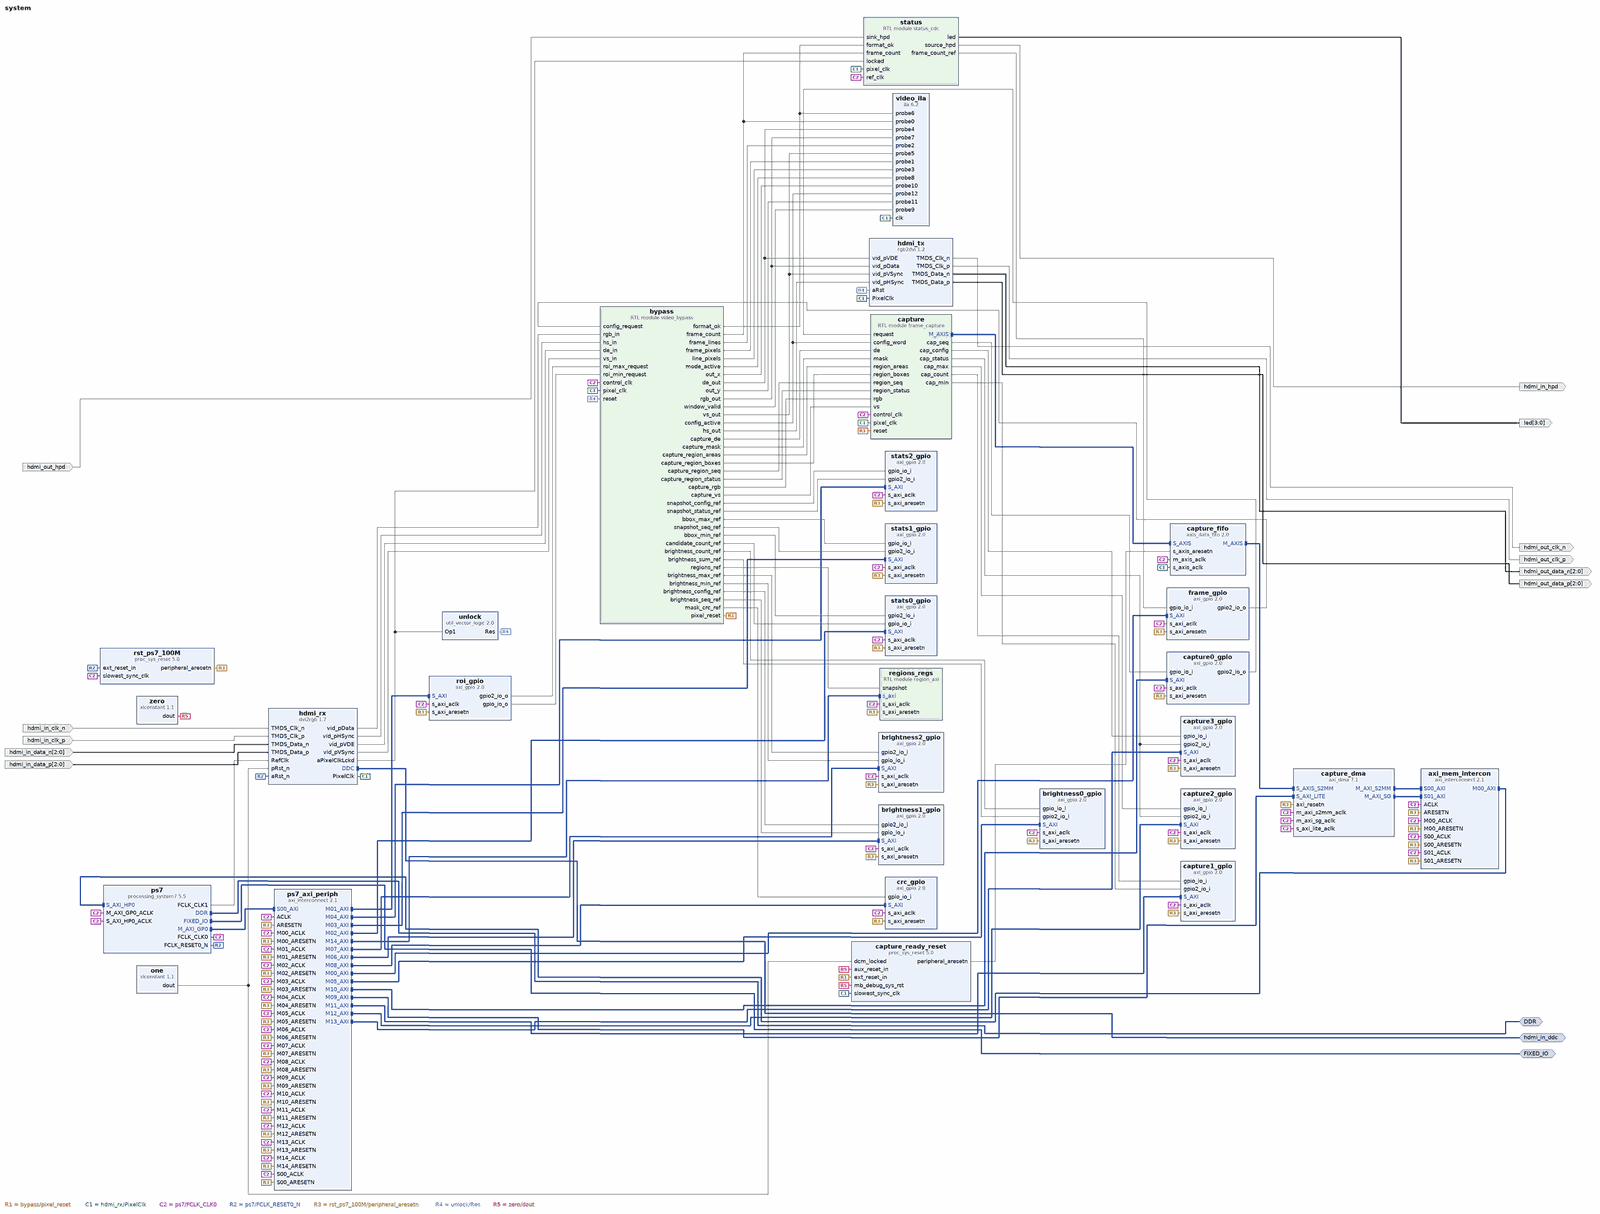
[diagram p0: block diagram of the top level, whole]
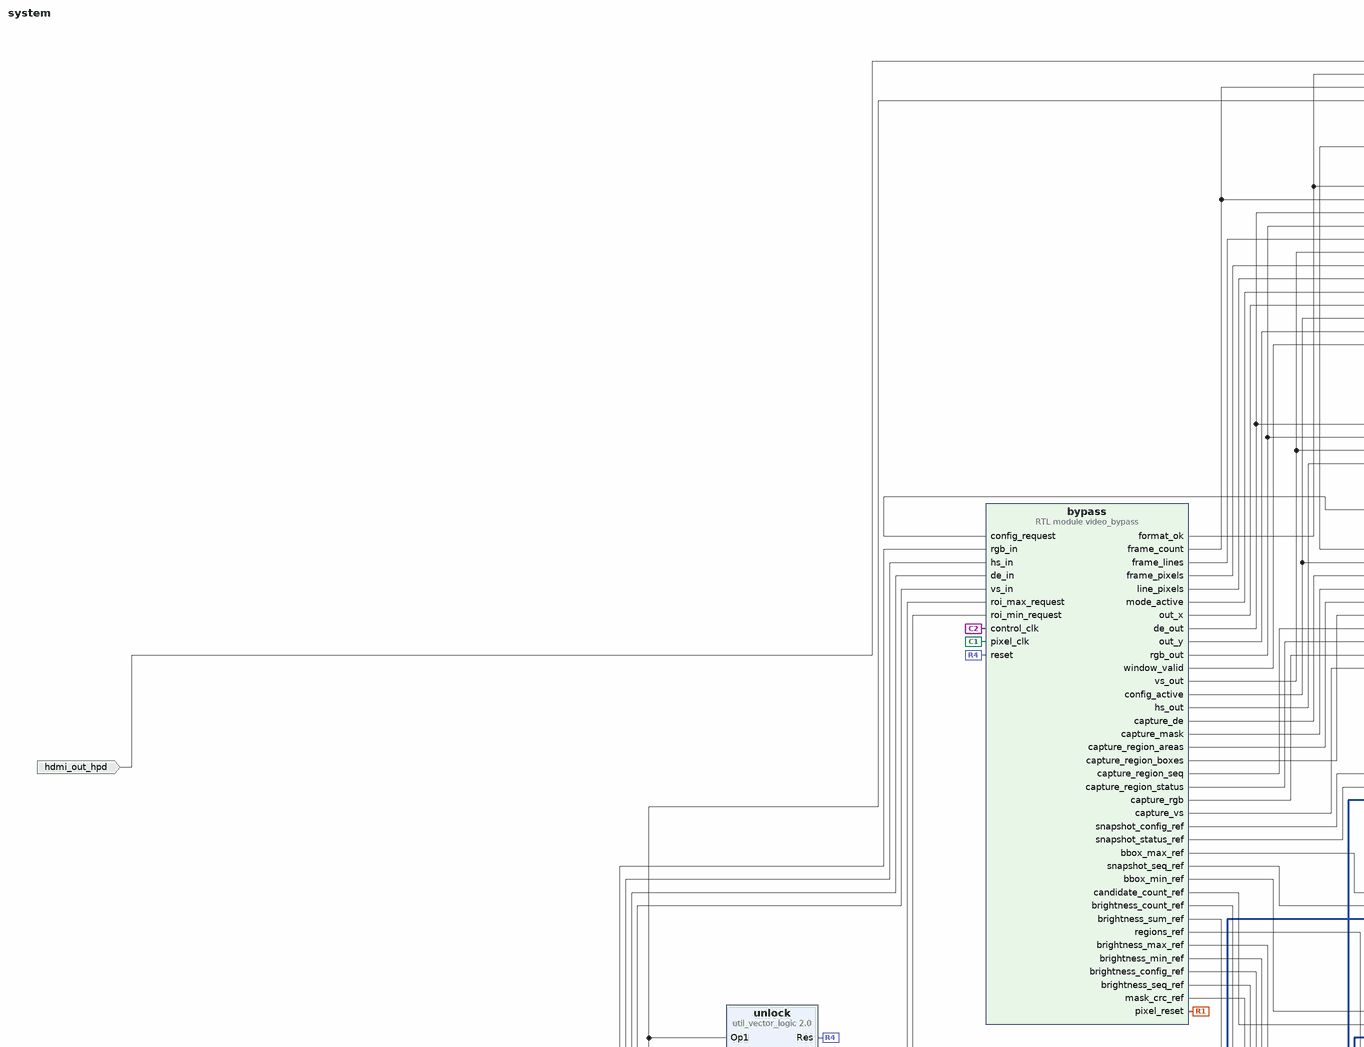
[diagram p1: block diagram of the top level, upper left part]
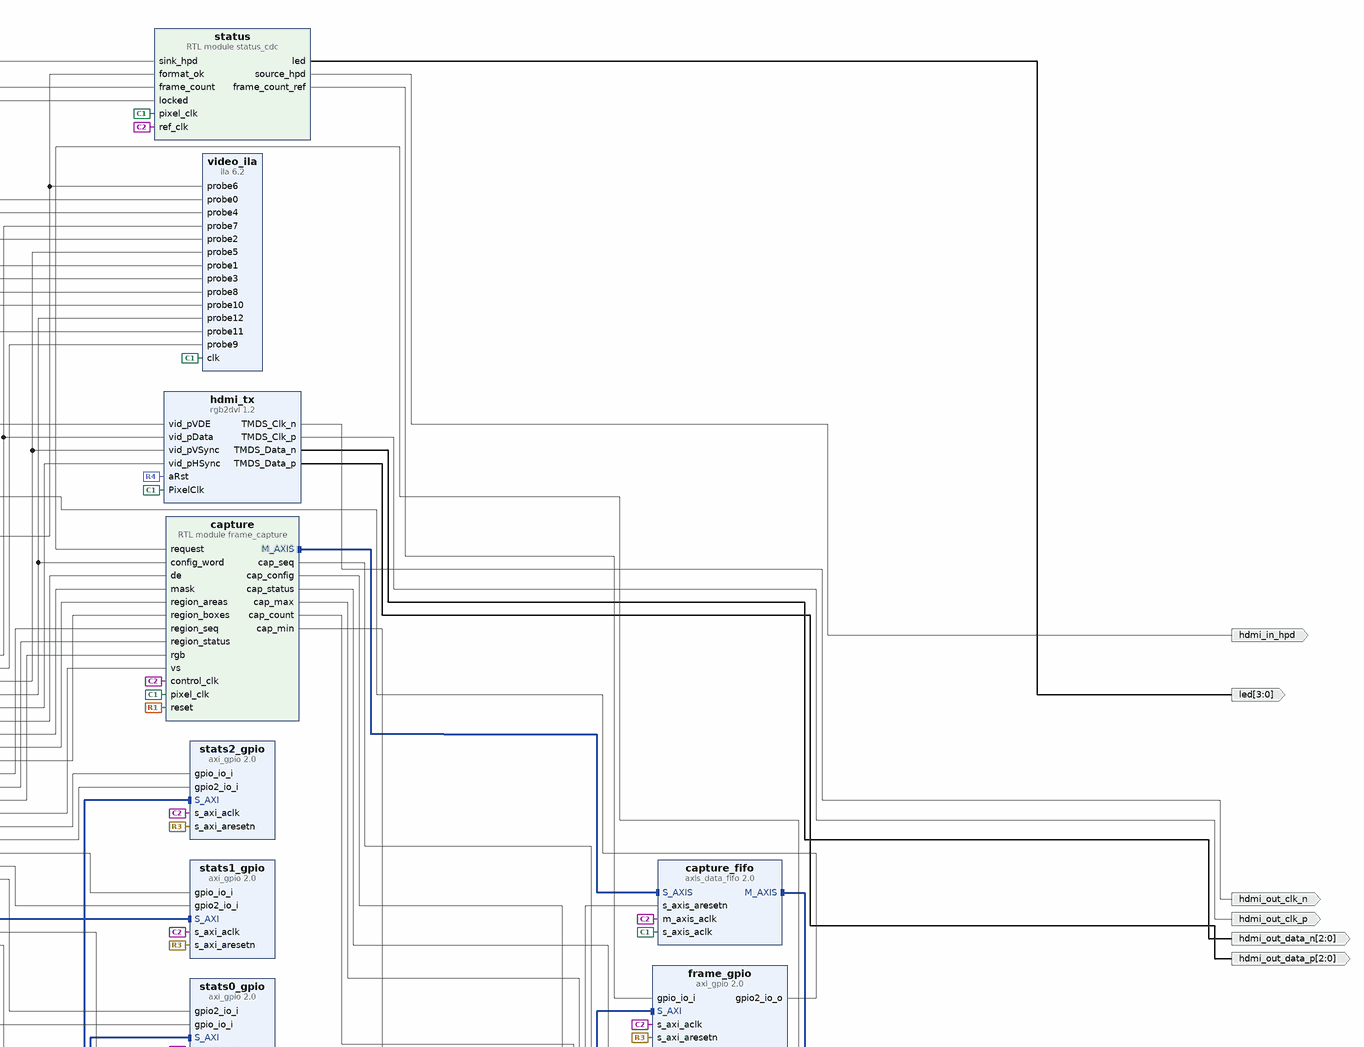
[diagram p2: block diagram of the top level, upper right part]
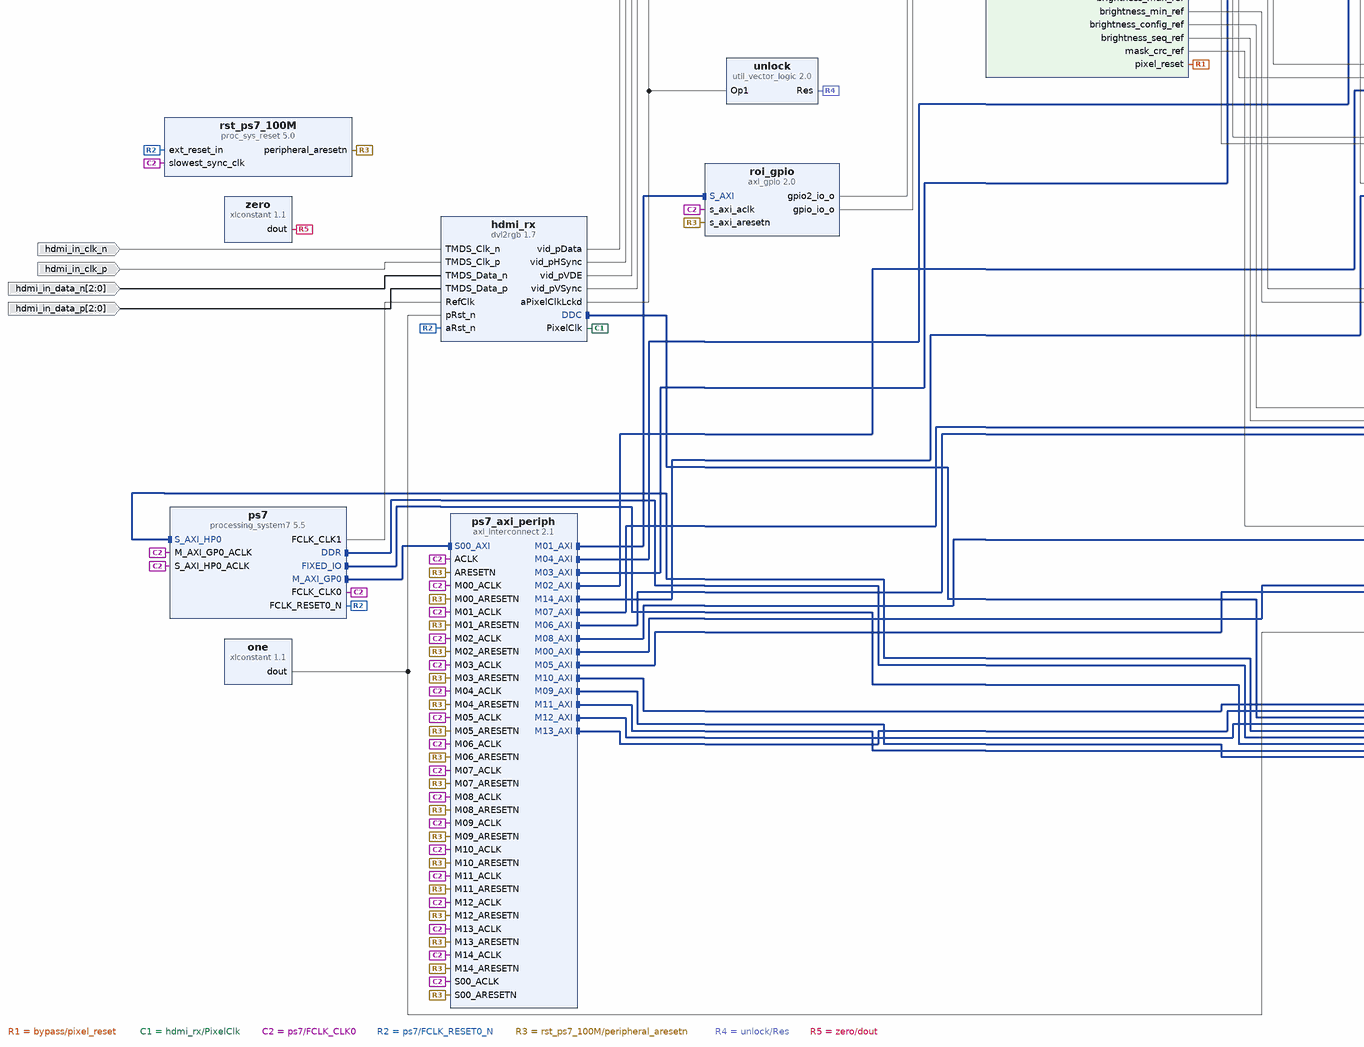
[diagram p3: block diagram of the top level, lower left part]
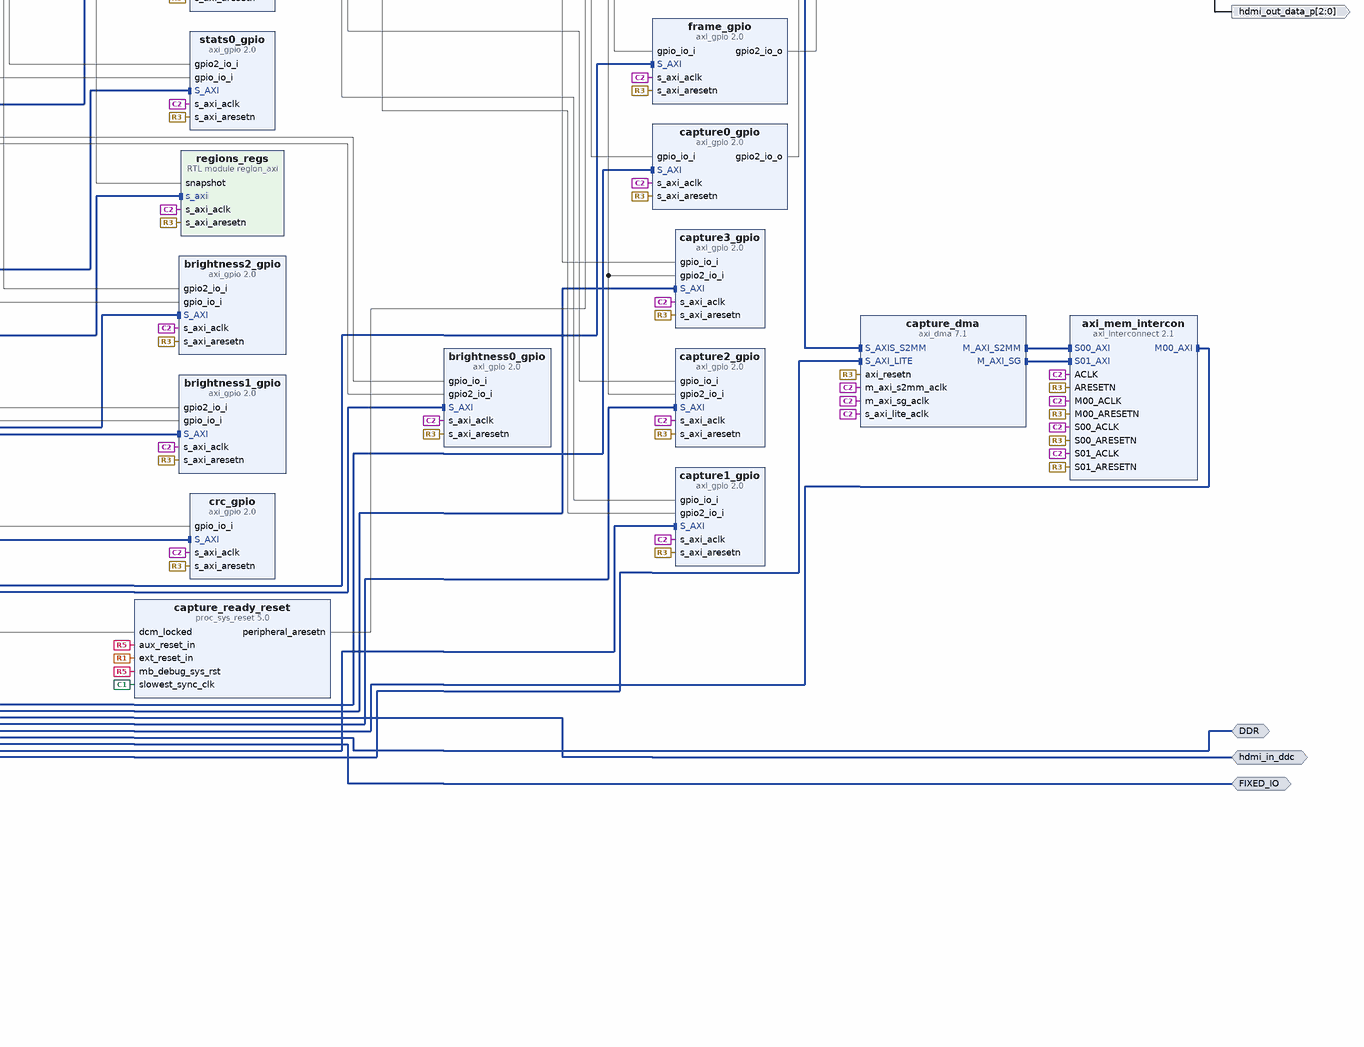
[diagram p4: block diagram of the top level, lower right part]
# Vivado block design system, xc7z020clg400-1, Vivado 2025.2
create_bd_design system

create_bd_intf_port -mode Master -vlnv xilinx.com:interface:ddrx_rtl:1.0 DDR
create_bd_intf_port -mode Master -vlnv xilinx.com:display_processing_system7:fixedio_rtl:1.0 FIXED_IO
create_bd_intf_port -mode Master -vlnv xilinx.com:interface:iic_rtl:1.0 hdmi_in_ddc
create_bd_port -dir I hdmi_in_clk_p
create_bd_port -dir I hdmi_in_clk_n
create_bd_port -dir I -from 2 -to 0 hdmi_in_data_p
create_bd_port -dir I -from 2 -to 0 hdmi_in_data_n
create_bd_port -dir O hdmi_out_clk_p
create_bd_port -dir O hdmi_out_clk_n
create_bd_port -dir O -from 2 -to 0 hdmi_out_data_p
create_bd_port -dir O -from 2 -to 0 hdmi_out_data_n
create_bd_port -dir I hdmi_out_hpd
create_bd_port -dir O hdmi_in_hpd
create_bd_port -dir O -from 3 -to 0 led

create_bd_cell -type ip -vlnv xilinx.com:ip:processing_system7:5.5 ps7
set_property -dict [list \
  CONFIG.PCW_APU_PERIPHERAL_FREQMHZ 650 \
  CONFIG.PCW_CRYSTAL_PERIPHERAL_FREQMHZ 50 \
  CONFIG.PCW_ENET0_ENET0_IO {MIO 16 .. 27} \
  CONFIG.PCW_ENET0_GRP_MDIO_ENABLE 1 \
  CONFIG.PCW_ENET0_GRP_MDIO_IO {MIO 52 .. 53} \
  CONFIG.PCW_ENET0_PERIPHERAL_ENABLE 1 \
  CONFIG.PCW_ENET0_RESET_ENABLE 1 \
  CONFIG.PCW_ENET0_RESET_IO {MIO 9} \
  CONFIG.PCW_ENET_RESET_ENABLE 1 \
  CONFIG.PCW_ENET_RESET_SELECT {Share reset pin} \
  CONFIG.PCW_EN_CLK1_PORT 1 \
  CONFIG.PCW_FPGA0_PERIPHERAL_FREQMHZ 100 \
  CONFIG.PCW_FPGA1_PERIPHERAL_FREQMHZ 200 \
  CONFIG.PCW_FPGA2_PERIPHERAL_FREQMHZ 200 \
  CONFIG.PCW_FPGA3_PERIPHERAL_FREQMHZ 166.67 \
  CONFIG.PCW_FPGA_FCLK1_ENABLE 1 \
  CONFIG.PCW_GPIO_MIO_GPIO_ENABLE 1 \
  CONFIG.PCW_GPIO_MIO_GPIO_IO MIO \
  CONFIG.PCW_I2C_RESET_ENABLE 1 \
  CONFIG.PCW_IRQ_F2P_INTR 1 \
  CONFIG.PCW_PERIPHERAL_BOARD_PRESET None \
  CONFIG.PCW_PRESET_BANK1_VOLTAGE {LVCMOS 1.8V} \
  CONFIG.PCW_QSPI_GRP_FBCLK_ENABLE 1 \
  CONFIG.PCW_QSPI_GRP_FBCLK_IO {MIO 8} \
  CONFIG.PCW_QSPI_GRP_SINGLE_SS_ENABLE 1 \
  CONFIG.PCW_QSPI_GRP_SINGLE_SS_IO {MIO 1 .. 6} \
  CONFIG.PCW_QSPI_PERIPHERAL_ENABLE 1 \
  CONFIG.PCW_QSPI_QSPI_IO {MIO 1 .. 6} \
  CONFIG.PCW_SD0_GRP_CD_ENABLE 1 \
  CONFIG.PCW_SD0_GRP_CD_IO {MIO 47} \
  CONFIG.PCW_SD0_GRP_WP_ENABLE 0 \
  CONFIG.PCW_SD0_PERIPHERAL_ENABLE 1 \
  CONFIG.PCW_SD0_SD0_IO {MIO 40 .. 45} \
  CONFIG.PCW_SDIO_PERIPHERAL_FREQMHZ 50 \
  CONFIG.PCW_SINGLE_QSPI_DATA_MODE x4 \
  CONFIG.PCW_UART0_PERIPHERAL_ENABLE 1 \
  CONFIG.PCW_UART0_UART0_IO {MIO 14 .. 15} \
  CONFIG.PCW_UART1_PERIPHERAL_ENABLE 0 \
  CONFIG.PCW_UART_PERIPHERAL_FREQMHZ 100 \
  CONFIG.PCW_UIPARAM_DDR_BUS_WIDTH {16 Bit} \
  CONFIG.PCW_UIPARAM_DDR_FREQ_MHZ 525 \
  CONFIG.PCW_UIPARAM_DDR_PARTNO {MT41J256M16 RE-125} \
  CONFIG.PCW_USB0_PERIPHERAL_ENABLE 1 \
  CONFIG.PCW_USB0_RESET_ENABLE 1 \
  CONFIG.PCW_USB0_RESET_IO {MIO 46} \
  CONFIG.PCW_USB0_USB0_IO {MIO 28 .. 39} \
  CONFIG.PCW_USB_RESET_ENABLE 1 \
  CONFIG.PCW_USB_RESET_SELECT {Share reset pin} \
  CONFIG.PCW_USE_FABRIC_INTERRUPT 1 \
  CONFIG.PCW_USE_S_AXI_HP0 1 \
] [get_bd_cells ps7]
# 494 more settings of ps7 are not shown: defaults, MIO pin electricals, DDR timing, and values the tool derives
create_bd_cell -type ip -vlnv digilentinc.com:ip:dvi2rgb:1.7 hdmi_rx
set_property -dict [list \
  CONFIG.kAddBUFG true \
  CONFIG.kClkRange 2 \
  CONFIG.kEdidFileName 720p_edid.data \
  CONFIG.kEmulateDDC true \
  CONFIG.kEnableSerialClkOutput true \
  CONFIG.kRstActiveHigh false \
] [get_bd_cells hdmi_rx]
create_bd_cell -type ip -vlnv digilentinc.com:ip:rgb2dvi:1.2 hdmi_tx
set_property -dict {CONFIG.kClkRange 2 CONFIG.kGenerateSerialClk true CONFIG.kRstActiveHigh true} [get_bd_cells hdmi_tx]
create_bd_cell -type module -reference video_bypass bypass
create_bd_cell -type module -reference status_cdc status
create_bd_cell -type ip -vlnv xilinx.com:ip:xlconstant:1.1 zero
set_property -dict {CONFIG.CONST_VAL 0} [get_bd_cells zero]
create_bd_cell -type ip -vlnv xilinx.com:ip:xlconstant:1.1 one
set_property -dict {CONFIG.CONST_VAL 1} [get_bd_cells one]
create_bd_cell -type ip -vlnv xilinx.com:ip:util_vector_logic:2.0 unlock
set_property -dict {CONFIG.C_OPERATION not CONFIG.C_SIZE 1} [get_bd_cells unlock]
create_bd_cell -type ip -vlnv xilinx.com:ip:axi_gpio:2.0 frame_gpio
set_property -dict [list \
  CONFIG.C_ALL_INPUTS 1 \
  CONFIG.C_ALL_OUTPUTS_2 1 \
  CONFIG.C_GPIO2_WIDTH 32 \
  CONFIG.C_GPIO_WIDTH 32 \
  CONFIG.C_IS_DUAL 1 \
] [get_bd_cells frame_gpio]
create_bd_cell -type ip -vlnv xilinx.com:ip:axi_interconnect:2.1 ps7_axi_periph
set_property -dict {CONFIG.NUM_MI 15} [get_bd_cells ps7_axi_periph]
create_bd_cell -type ip -vlnv xilinx.com:ip:proc_sys_reset:5.0 rst_ps7_100M
create_bd_cell -type ip -vlnv xilinx.com:ip:axi_gpio:2.0 roi_gpio
set_property -dict [list \
  CONFIG.C_ALL_OUTPUTS 1 \
  CONFIG.C_ALL_OUTPUTS_2 1 \
  CONFIG.C_GPIO2_WIDTH 32 \
  CONFIG.C_GPIO_WIDTH 32 \
  CONFIG.C_IS_DUAL 1 \
] [get_bd_cells roi_gpio]
create_bd_cell -type ip -vlnv xilinx.com:ip:axi_gpio:2.0 stats0_gpio
set_property -dict [list \
  CONFIG.C_ALL_INPUTS 1 \
  CONFIG.C_ALL_INPUTS_2 1 \
  CONFIG.C_GPIO2_WIDTH 32 \
  CONFIG.C_GPIO_WIDTH 32 \
  CONFIG.C_IS_DUAL 1 \
] [get_bd_cells stats0_gpio]
create_bd_cell -type ip -vlnv xilinx.com:ip:axi_gpio:2.0 stats1_gpio
set_property -dict [list \
  CONFIG.C_ALL_INPUTS 1 \
  CONFIG.C_ALL_INPUTS_2 1 \
  CONFIG.C_GPIO2_WIDTH 32 \
  CONFIG.C_GPIO_WIDTH 32 \
  CONFIG.C_IS_DUAL 1 \
] [get_bd_cells stats1_gpio]
create_bd_cell -type ip -vlnv xilinx.com:ip:axi_gpio:2.0 stats2_gpio
set_property -dict [list \
  CONFIG.C_ALL_INPUTS 1 \
  CONFIG.C_ALL_INPUTS_2 1 \
  CONFIG.C_GPIO2_WIDTH 32 \
  CONFIG.C_GPIO_WIDTH 32 \
  CONFIG.C_IS_DUAL 1 \
] [get_bd_cells stats2_gpio]
create_bd_cell -type ip -vlnv xilinx.com:ip:axi_gpio:2.0 brightness0_gpio
set_property -dict [list \
  CONFIG.C_ALL_INPUTS 1 \
  CONFIG.C_ALL_INPUTS_2 1 \
  CONFIG.C_GPIO2_WIDTH 32 \
  CONFIG.C_GPIO_WIDTH 32 \
  CONFIG.C_IS_DUAL 1 \
] [get_bd_cells brightness0_gpio]
create_bd_cell -type ip -vlnv xilinx.com:ip:axi_gpio:2.0 brightness1_gpio
set_property -dict [list \
  CONFIG.C_ALL_INPUTS 1 \
  CONFIG.C_ALL_INPUTS_2 1 \
  CONFIG.C_GPIO2_WIDTH 32 \
  CONFIG.C_GPIO_WIDTH 32 \
  CONFIG.C_IS_DUAL 1 \
] [get_bd_cells brightness1_gpio]
create_bd_cell -type ip -vlnv xilinx.com:ip:axi_gpio:2.0 brightness2_gpio
set_property -dict [list \
  CONFIG.C_ALL_INPUTS 1 \
  CONFIG.C_ALL_INPUTS_2 1 \
  CONFIG.C_GPIO2_WIDTH 32 \
  CONFIG.C_GPIO_WIDTH 32 \
  CONFIG.C_IS_DUAL 1 \
] [get_bd_cells brightness2_gpio]
create_bd_cell -type ip -vlnv xilinx.com:ip:axi_gpio:2.0 crc_gpio
set_property -dict {CONFIG.C_ALL_INPUTS 1 CONFIG.C_GPIO_WIDTH 32} [get_bd_cells crc_gpio]
create_bd_cell -type ip -vlnv xilinx.com:ip:ila:6.2 video_ila
set_property -dict [list \
  CONFIG.C_DATA_DEPTH 1024 \
  CONFIG.C_MONITOR_TYPE Native \
  CONFIG.C_NUM_OF_PROBES 13 \
  CONFIG.C_PROBE0_WIDTH 32 \
  CONFIG.C_PROBE10_WIDTH 16 \
  CONFIG.C_PROBE11_WIDTH 16 \
  CONFIG.C_PROBE12_WIDTH 32 \
  CONFIG.C_PROBE1_WIDTH 32 \
  CONFIG.C_PROBE2_WIDTH 16 \
  CONFIG.C_PROBE3_WIDTH 16 \
  CONFIG.C_PROBE4_WIDTH 1 \
  CONFIG.C_PROBE5_WIDTH 1 \
  CONFIG.C_PROBE6_WIDTH 1 \
  CONFIG.C_PROBE7_WIDTH 24 \
  CONFIG.C_PROBE8_WIDTH 3 \
  CONFIG.C_PROBE9_WIDTH 1 \
] [get_bd_cells video_ila]
create_bd_cell -type module -reference frame_capture capture
create_bd_cell -type ip -vlnv xilinx.com:ip:axis_data_fifo:2.0 capture_fifo
set_property -dict [list \
  CONFIG.FIFO_DEPTH 4096 \
  CONFIG.HAS_TKEEP 0 \
  CONFIG.HAS_TLAST 1 \
  CONFIG.IS_ACLK_ASYNC 1 \
  CONFIG.TDATA_NUM_BYTES 4 \
] [get_bd_cells capture_fifo]
create_bd_cell -type ip -vlnv xilinx.com:ip:proc_sys_reset:5.0 capture_ready_reset
set_property -dict {CONFIG.C_AUX_RESET_HIGH 1} [get_bd_cells capture_ready_reset]
create_bd_cell -type ip -vlnv xilinx.com:ip:axi_dma:7.1 capture_dma
set_property -dict [list \
  CONFIG.c_include_mm2s 0 \
  CONFIG.c_include_s2mm 1 \
  CONFIG.c_include_sg 1 \
  CONFIG.c_m_axi_s2mm_data_width 64 \
  CONFIG.c_s2mm_burst_size 64 \
  CONFIG.c_s_axis_s2mm_tdata_width 32 \
  CONFIG.c_sg_include_stscntrl_strm 0 \
  CONFIG.c_sg_length_width 26 \
] [get_bd_cells capture_dma]
create_bd_cell -type ip -vlnv xilinx.com:ip:axi_interconnect:2.1 axi_mem_intercon
set_property -dict {CONFIG.NUM_MI 1 CONFIG.NUM_SI 2} [get_bd_cells axi_mem_intercon]
create_bd_cell -type ip -vlnv xilinx.com:ip:axi_gpio:2.0 capture0_gpio
set_property -dict [list \
  CONFIG.C_ALL_INPUTS 1 \
  CONFIG.C_ALL_INPUTS_2 0 \
  CONFIG.C_ALL_OUTPUTS_2 1 \
  CONFIG.C_GPIO2_WIDTH 32 \
  CONFIG.C_GPIO_WIDTH 32 \
  CONFIG.C_IS_DUAL 1 \
] [get_bd_cells capture0_gpio]
create_bd_cell -type ip -vlnv xilinx.com:ip:axi_gpio:2.0 capture1_gpio
set_property -dict [list \
  CONFIG.C_ALL_INPUTS 1 \
  CONFIG.C_ALL_INPUTS_2 1 \
  CONFIG.C_GPIO2_WIDTH 32 \
  CONFIG.C_GPIO_WIDTH 32 \
  CONFIG.C_IS_DUAL 1 \
] [get_bd_cells capture1_gpio]
create_bd_cell -type ip -vlnv xilinx.com:ip:axi_gpio:2.0 capture2_gpio
set_property -dict [list \
  CONFIG.C_ALL_INPUTS 1 \
  CONFIG.C_ALL_INPUTS_2 1 \
  CONFIG.C_GPIO2_WIDTH 32 \
  CONFIG.C_GPIO_WIDTH 32 \
  CONFIG.C_IS_DUAL 1 \
] [get_bd_cells capture2_gpio]
create_bd_cell -type ip -vlnv xilinx.com:ip:axi_gpio:2.0 capture3_gpio
set_property -dict [list \
  CONFIG.C_ALL_INPUTS 1 \
  CONFIG.C_ALL_INPUTS_2 1 \
  CONFIG.C_GPIO2_WIDTH 32 \
  CONFIG.C_GPIO_WIDTH 32 \
  CONFIG.C_IS_DUAL 1 \
] [get_bd_cells capture3_gpio]
create_bd_cell -type module -reference region_axi regions_regs

# ---- connections ----

connect_bd_intf_net [get_bd_intf_pins axi_mem_intercon/M00_AXI] [get_bd_intf_pins ps7/S_AXI_HP0]
connect_bd_intf_net [get_bd_intf_pins capture/M_AXIS] [get_bd_intf_pins capture_fifo/S_AXIS]
connect_bd_intf_net [get_bd_intf_pins capture_dma/M_AXI_S2MM] [get_bd_intf_pins axi_mem_intercon/S00_AXI]
connect_bd_intf_net [get_bd_intf_pins capture_dma/M_AXI_SG] [get_bd_intf_pins axi_mem_intercon/S01_AXI]
connect_bd_intf_net [get_bd_intf_pins capture_fifo/M_AXIS] [get_bd_intf_pins capture_dma/S_AXIS_S2MM]
connect_bd_intf_net [get_bd_intf_ports hdmi_in_ddc] [get_bd_intf_pins hdmi_rx/DDC]
connect_bd_intf_net [get_bd_intf_ports DDR] [get_bd_intf_pins ps7/DDR]
connect_bd_intf_net [get_bd_intf_ports FIXED_IO] [get_bd_intf_pins ps7/FIXED_IO]
connect_bd_intf_net [get_bd_intf_pins ps7/M_AXI_GP0] [get_bd_intf_pins ps7_axi_periph/S00_AXI]
connect_bd_intf_net [get_bd_intf_pins ps7_axi_periph/M00_AXI] [get_bd_intf_pins frame_gpio/S_AXI]
connect_bd_intf_net [get_bd_intf_pins ps7_axi_periph/M01_AXI] [get_bd_intf_pins roi_gpio/S_AXI]
connect_bd_intf_net [get_bd_intf_pins ps7_axi_periph/M02_AXI] [get_bd_intf_pins stats0_gpio/S_AXI]
connect_bd_intf_net [get_bd_intf_pins ps7_axi_periph/M03_AXI] [get_bd_intf_pins stats1_gpio/S_AXI]
connect_bd_intf_net [get_bd_intf_pins ps7_axi_periph/M04_AXI] [get_bd_intf_pins stats2_gpio/S_AXI]
connect_bd_intf_net [get_bd_intf_pins ps7_axi_periph/M05_AXI] [get_bd_intf_pins brightness0_gpio/S_AXI]
connect_bd_intf_net [get_bd_intf_pins ps7_axi_periph/M06_AXI] [get_bd_intf_pins brightness1_gpio/S_AXI]
connect_bd_intf_net [get_bd_intf_pins ps7_axi_periph/M07_AXI] [get_bd_intf_pins brightness2_gpio/S_AXI]
connect_bd_intf_net [get_bd_intf_pins ps7_axi_periph/M08_AXI] [get_bd_intf_pins crc_gpio/S_AXI]
connect_bd_intf_net [get_bd_intf_pins ps7_axi_periph/M09_AXI] [get_bd_intf_pins capture_dma/S_AXI_LITE]
connect_bd_intf_net [get_bd_intf_pins ps7_axi_periph/M10_AXI] [get_bd_intf_pins capture0_gpio/S_AXI]
connect_bd_intf_net [get_bd_intf_pins ps7_axi_periph/M11_AXI] [get_bd_intf_pins capture1_gpio/S_AXI]
connect_bd_intf_net [get_bd_intf_pins ps7_axi_periph/M12_AXI] [get_bd_intf_pins capture2_gpio/S_AXI]
connect_bd_intf_net [get_bd_intf_pins ps7_axi_periph/M13_AXI] [get_bd_intf_pins capture3_gpio/S_AXI]
connect_bd_intf_net [get_bd_intf_pins ps7_axi_periph/M14_AXI] [get_bd_intf_pins regions_regs/s_axi]
connect_bd_net [get_bd_pins bypass/bbox_max_ref] [get_bd_pins stats1_gpio/gpio_io_i]
connect_bd_net [get_bd_pins bypass/bbox_min_ref] [get_bd_pins stats0_gpio/gpio2_io_i]
connect_bd_net [get_bd_pins bypass/brightness_config_ref] [get_bd_pins brightness1_gpio/gpio2_io_i]
connect_bd_net [get_bd_pins bypass/brightness_count_ref] [get_bd_pins brightness0_gpio/gpio_io_i]
connect_bd_net [get_bd_pins bypass/brightness_max_ref] [get_bd_pins brightness2_gpio/gpio2_io_i]
connect_bd_net [get_bd_pins bypass/brightness_min_ref] [get_bd_pins brightness2_gpio/gpio_io_i]
connect_bd_net [get_bd_pins bypass/brightness_seq_ref] [get_bd_pins brightness1_gpio/gpio_io_i]
connect_bd_net [get_bd_pins bypass/brightness_sum_ref] [get_bd_pins brightness0_gpio/gpio2_io_i]
connect_bd_net [get_bd_pins bypass/candidate_count_ref] [get_bd_pins stats0_gpio/gpio_io_i]
connect_bd_net [get_bd_pins bypass/capture_de] [get_bd_pins capture/de]
connect_bd_net [get_bd_pins bypass/capture_mask] [get_bd_pins capture/mask]
connect_bd_net [get_bd_pins bypass/capture_region_areas] [get_bd_pins capture/region_areas]
connect_bd_net [get_bd_pins bypass/capture_region_boxes] [get_bd_pins capture/region_boxes]
connect_bd_net [get_bd_pins bypass/capture_region_seq] [get_bd_pins capture/region_seq]
connect_bd_net [get_bd_pins bypass/capture_region_status] [get_bd_pins capture/region_status]
connect_bd_net [get_bd_pins bypass/capture_rgb] [get_bd_pins capture/rgb]
connect_bd_net [get_bd_pins bypass/capture_vs] [get_bd_pins capture/vs]
connect_bd_net [get_bd_pins bypass/config_active] [get_bd_pins video_ila/probe12] [get_bd_pins capture/config_word]
connect_bd_net [get_bd_pins bypass/de_out] [get_bd_pins hdmi_tx/vid_pVDE] [get_bd_pins video_ila/probe4]
connect_bd_net [get_bd_pins bypass/format_ok] [get_bd_pins status/format_ok] [get_bd_pins video_ila/probe6]
connect_bd_net [get_bd_pins bypass/frame_count] [get_bd_pins status/frame_count] [get_bd_pins video_ila/probe0]
connect_bd_net [get_bd_pins bypass/frame_lines] [get_bd_pins video_ila/probe2]
connect_bd_net [get_bd_pins bypass/frame_pixels] [get_bd_pins video_ila/probe1]
connect_bd_net [get_bd_pins bypass/hs_out] [get_bd_pins hdmi_tx/vid_pHSync]
connect_bd_net [get_bd_pins bypass/line_pixels] [get_bd_pins video_ila/probe3]
connect_bd_net [get_bd_pins bypass/mask_crc_ref] [get_bd_pins crc_gpio/gpio_io_i]
connect_bd_net [get_bd_pins bypass/mode_active] [get_bd_pins video_ila/probe8]
connect_bd_net [get_bd_pins bypass/out_x] [get_bd_pins video_ila/probe10]
connect_bd_net [get_bd_pins bypass/out_y] [get_bd_pins video_ila/probe11]
connect_bd_net [get_bd_pins bypass/pixel_reset] [get_bd_pins capture/reset] [get_bd_pins capture_ready_reset/ext_reset_in]
connect_bd_net [get_bd_pins bypass/regions_ref] [get_bd_pins regions_regs/snapshot]
connect_bd_net [get_bd_pins bypass/rgb_out] [get_bd_pins hdmi_tx/vid_pData] [get_bd_pins video_ila/probe7]
connect_bd_net [get_bd_pins bypass/snapshot_config_ref] [get_bd_pins stats2_gpio/gpio_io_i]
connect_bd_net [get_bd_pins bypass/snapshot_seq_ref] [get_bd_pins stats1_gpio/gpio2_io_i]
connect_bd_net [get_bd_pins bypass/snapshot_status_ref] [get_bd_pins stats2_gpio/gpio2_io_i]
connect_bd_net [get_bd_pins bypass/vs_out] [get_bd_pins hdmi_tx/vid_pVSync] [get_bd_pins video_ila/probe5]
connect_bd_net [get_bd_pins bypass/window_valid] [get_bd_pins video_ila/probe9]
connect_bd_net [get_bd_pins capture0_gpio/gpio2_io_o] [get_bd_pins capture/request]
connect_bd_net [get_bd_pins capture/cap_config] [get_bd_pins capture3_gpio/gpio_io_i]
connect_bd_net [get_bd_pins capture/cap_count] [get_bd_pins capture1_gpio/gpio_io_i]
connect_bd_net [get_bd_pins capture/cap_max] [get_bd_pins capture2_gpio/gpio_io_i]
connect_bd_net [get_bd_pins capture/cap_min] [get_bd_pins capture1_gpio/gpio2_io_i]
connect_bd_net [get_bd_pins capture/cap_seq] [get_bd_pins capture0_gpio/gpio_io_i]
connect_bd_net [get_bd_pins capture/cap_status] [get_bd_pins capture2_gpio/gpio2_io_i] [get_bd_pins capture3_gpio/gpio2_io_i]
connect_bd_net [get_bd_pins capture_ready_reset/peripheral_aresetn] [get_bd_pins capture_fifo/s_axis_aresetn]
connect_bd_net [get_bd_pins frame_gpio/gpio2_io_o] [get_bd_pins bypass/config_request]
connect_bd_net [get_bd_ports hdmi_in_clk_n] [get_bd_pins hdmi_rx/TMDS_Clk_n]
connect_bd_net [get_bd_ports hdmi_in_clk_p] [get_bd_pins hdmi_rx/TMDS_Clk_p]
connect_bd_net [get_bd_ports hdmi_in_data_n] [get_bd_pins hdmi_rx/TMDS_Data_n]
connect_bd_net [get_bd_ports hdmi_in_data_p] [get_bd_pins hdmi_rx/TMDS_Data_p]
connect_bd_net [get_bd_ports hdmi_out_hpd] [get_bd_pins status/sink_hpd]
connect_bd_net [get_bd_pins hdmi_rx/PixelClk] \
  [get_bd_pins bypass/pixel_clk] [get_bd_pins status/pixel_clk] [get_bd_pins hdmi_tx/PixelClk] [get_bd_pins video_ila/clk] \
  [get_bd_pins capture/pixel_clk] [get_bd_pins capture_fifo/s_axis_aclk] [get_bd_pins capture_ready_reset/slowest_sync_clk]
connect_bd_net [get_bd_pins hdmi_rx/aPixelClkLckd] [get_bd_pins unlock/Op1] [get_bd_pins status/locked]
connect_bd_net [get_bd_pins hdmi_rx/vid_pData] [get_bd_pins bypass/rgb_in]
connect_bd_net [get_bd_pins hdmi_rx/vid_pHSync] [get_bd_pins bypass/hs_in]
connect_bd_net [get_bd_pins hdmi_rx/vid_pVDE] [get_bd_pins bypass/de_in]
connect_bd_net [get_bd_pins hdmi_rx/vid_pVSync] [get_bd_pins bypass/vs_in]
connect_bd_net [get_bd_pins hdmi_tx/TMDS_Clk_n] [get_bd_ports hdmi_out_clk_n]
connect_bd_net [get_bd_pins hdmi_tx/TMDS_Clk_p] [get_bd_ports hdmi_out_clk_p]
connect_bd_net [get_bd_pins hdmi_tx/TMDS_Data_n] [get_bd_ports hdmi_out_data_n]
connect_bd_net [get_bd_pins hdmi_tx/TMDS_Data_p] [get_bd_ports hdmi_out_data_p]
connect_bd_net [get_bd_pins one/dout] [get_bd_pins hdmi_rx/pRst_n] [get_bd_pins capture_ready_reset/dcm_locked]
connect_bd_net [get_bd_pins ps7/FCLK_CLK0] \
  [get_bd_pins status/ref_clk] [get_bd_pins bypass/control_clk] [get_bd_pins ps7_axi_periph/ACLK] \
  [get_bd_pins ps7/M_AXI_GP0_ACLK] [get_bd_pins ps7_axi_periph/S00_ACLK] [get_bd_pins rst_ps7_100M/slowest_sync_clk] \
  [get_bd_pins frame_gpio/s_axi_aclk] [get_bd_pins ps7_axi_periph/M00_ACLK] [get_bd_pins roi_gpio/s_axi_aclk] \
  [get_bd_pins ps7_axi_periph/M01_ACLK] [get_bd_pins stats0_gpio/s_axi_aclk] [get_bd_pins ps7_axi_periph/M02_ACLK] \
  [get_bd_pins stats1_gpio/s_axi_aclk] [get_bd_pins ps7_axi_periph/M03_ACLK] [get_bd_pins stats2_gpio/s_axi_aclk] \
  [get_bd_pins ps7_axi_periph/M04_ACLK] [get_bd_pins brightness0_gpio/s_axi_aclk] [get_bd_pins ps7_axi_periph/M05_ACLK] \
  [get_bd_pins brightness1_gpio/s_axi_aclk] [get_bd_pins ps7_axi_periph/M06_ACLK] [get_bd_pins brightness2_gpio/s_axi_aclk] \
  [get_bd_pins ps7_axi_periph/M07_ACLK] [get_bd_pins crc_gpio/s_axi_aclk] [get_bd_pins ps7_axi_periph/M08_ACLK] \
  [get_bd_pins ps7/S_AXI_HP0_ACLK] [get_bd_pins capture/control_clk] [get_bd_pins capture_fifo/m_axis_aclk] \
  [get_bd_pins capture_dma/s_axi_lite_aclk] [get_bd_pins ps7_axi_periph/M09_ACLK] [get_bd_pins axi_mem_intercon/ACLK] \
  [get_bd_pins capture_dma/m_axi_s2mm_aclk] [get_bd_pins axi_mem_intercon/S00_ACLK] [get_bd_pins axi_mem_intercon/M00_ACLK] \
  [get_bd_pins capture_dma/m_axi_sg_aclk] [get_bd_pins axi_mem_intercon/S01_ACLK] [get_bd_pins capture0_gpio/s_axi_aclk] \
  [get_bd_pins ps7_axi_periph/M10_ACLK] [get_bd_pins capture1_gpio/s_axi_aclk] [get_bd_pins ps7_axi_periph/M11_ACLK] \
  [get_bd_pins capture2_gpio/s_axi_aclk] [get_bd_pins ps7_axi_periph/M12_ACLK] [get_bd_pins capture3_gpio/s_axi_aclk] \
  [get_bd_pins ps7_axi_periph/M13_ACLK] [get_bd_pins regions_regs/s_axi_aclk] [get_bd_pins ps7_axi_periph/M14_ACLK]
connect_bd_net [get_bd_pins ps7/FCLK_CLK1] [get_bd_pins hdmi_rx/RefClk]
connect_bd_net [get_bd_pins ps7/FCLK_RESET0_N] [get_bd_pins hdmi_rx/aRst_n] [get_bd_pins rst_ps7_100M/ext_reset_in]
connect_bd_net [get_bd_pins roi_gpio/gpio2_io_o] [get_bd_pins bypass/roi_max_request]
connect_bd_net [get_bd_pins roi_gpio/gpio_io_o] [get_bd_pins bypass/roi_min_request]
connect_bd_net [get_bd_pins rst_ps7_100M/peripheral_aresetn] \
  [get_bd_pins ps7_axi_periph/S00_ARESETN] [get_bd_pins frame_gpio/s_axi_aresetn] [get_bd_pins ps7_axi_periph/M00_ARESETN] \
  [get_bd_pins ps7_axi_periph/ARESETN] [get_bd_pins roi_gpio/s_axi_aresetn] [get_bd_pins ps7_axi_periph/M01_ARESETN] \
  [get_bd_pins stats0_gpio/s_axi_aresetn] [get_bd_pins ps7_axi_periph/M02_ARESETN] [get_bd_pins stats1_gpio/s_axi_aresetn] \
  [get_bd_pins ps7_axi_periph/M03_ARESETN] [get_bd_pins stats2_gpio/s_axi_aresetn] [get_bd_pins ps7_axi_periph/M04_ARESETN] \
  [get_bd_pins brightness0_gpio/s_axi_aresetn] [get_bd_pins ps7_axi_periph/M05_ARESETN] \
  [get_bd_pins brightness1_gpio/s_axi_aresetn] [get_bd_pins ps7_axi_periph/M06_ARESETN] \
  [get_bd_pins brightness2_gpio/s_axi_aresetn] [get_bd_pins ps7_axi_periph/M07_ARESETN] [get_bd_pins crc_gpio/s_axi_aresetn] \
  [get_bd_pins ps7_axi_periph/M08_ARESETN] [get_bd_pins capture_dma/axi_resetn] [get_bd_pins ps7_axi_periph/M09_ARESETN] \
  [get_bd_pins axi_mem_intercon/S00_ARESETN] [get_bd_pins axi_mem_intercon/M00_ARESETN] \
  [get_bd_pins axi_mem_intercon/ARESETN] [get_bd_pins axi_mem_intercon/S01_ARESETN] [get_bd_pins capture0_gpio/s_axi_aresetn] \
  [get_bd_pins ps7_axi_periph/M10_ARESETN] [get_bd_pins capture1_gpio/s_axi_aresetn] [get_bd_pins ps7_axi_periph/M11_ARESETN] \
  [get_bd_pins capture2_gpio/s_axi_aresetn] [get_bd_pins ps7_axi_periph/M12_ARESETN] \
  [get_bd_pins capture3_gpio/s_axi_aresetn] [get_bd_pins ps7_axi_periph/M13_ARESETN] [get_bd_pins regions_regs/s_axi_aresetn] \
  [get_bd_pins ps7_axi_periph/M14_ARESETN]
connect_bd_net [get_bd_pins status/frame_count_ref] [get_bd_pins frame_gpio/gpio_io_i]
connect_bd_net [get_bd_pins status/led] [get_bd_ports led]
connect_bd_net [get_bd_pins status/source_hpd] [get_bd_ports hdmi_in_hpd]
connect_bd_net [get_bd_pins unlock/Res] [get_bd_pins bypass/reset] [get_bd_pins hdmi_tx/aRst]
connect_bd_net [get_bd_pins zero/dout] [get_bd_pins capture_ready_reset/aux_reset_in] [get_bd_pins capture_ready_reset/mb_debug_sys_rst]

# ---- address map ----
assign_bd_address -offset 0x00000000 -range 512M -target_address_space [get_bd_addr_spaces capture_dma/Data_S2MM] [get_bd_addr_segs ps7/S_AXI_HP0/HP0_DDR_LOWOCM]
assign_bd_address -offset 0x00000000 -range 512M -target_address_space [get_bd_addr_spaces capture_dma/Data_SG] [get_bd_addr_segs ps7/S_AXI_HP0/HP0_DDR_LOWOCM]
assign_bd_address -offset 0x40400000 -range 64K -target_address_space [get_bd_addr_spaces ps7/Data] [get_bd_addr_segs capture_dma/S_AXI_LITE/Reg]
assign_bd_address -offset 0x41200000 -range 64K -target_address_space [get_bd_addr_spaces ps7/Data] [get_bd_addr_segs frame_gpio/S_AXI/Reg]
assign_bd_address -offset 0x41210000 -range 64K -target_address_space [get_bd_addr_spaces ps7/Data] [get_bd_addr_segs roi_gpio/S_AXI/Reg]
assign_bd_address -offset 0x41220000 -range 64K -target_address_space [get_bd_addr_spaces ps7/Data] [get_bd_addr_segs stats0_gpio/S_AXI/Reg]
assign_bd_address -offset 0x41230000 -range 64K -target_address_space [get_bd_addr_spaces ps7/Data] [get_bd_addr_segs stats1_gpio/S_AXI/Reg]
assign_bd_address -offset 0x41240000 -range 64K -target_address_space [get_bd_addr_spaces ps7/Data] [get_bd_addr_segs stats2_gpio/S_AXI/Reg]
assign_bd_address -offset 0x41250000 -range 64K -target_address_space [get_bd_addr_spaces ps7/Data] [get_bd_addr_segs brightness0_gpio/S_AXI/Reg]
assign_bd_address -offset 0x41260000 -range 64K -target_address_space [get_bd_addr_spaces ps7/Data] [get_bd_addr_segs brightness1_gpio/S_AXI/Reg]
assign_bd_address -offset 0x41270000 -range 64K -target_address_space [get_bd_addr_spaces ps7/Data] [get_bd_addr_segs brightness2_gpio/S_AXI/Reg]
assign_bd_address -offset 0x41280000 -range 64K -target_address_space [get_bd_addr_spaces ps7/Data] [get_bd_addr_segs crc_gpio/S_AXI/Reg]
assign_bd_address -offset 0x41290000 -range 64K -target_address_space [get_bd_addr_spaces ps7/Data] [get_bd_addr_segs capture0_gpio/S_AXI/Reg]
assign_bd_address -offset 0x412A0000 -range 64K -target_address_space [get_bd_addr_spaces ps7/Data] [get_bd_addr_segs capture1_gpio/S_AXI/Reg]
assign_bd_address -offset 0x412B0000 -range 64K -target_address_space [get_bd_addr_spaces ps7/Data] [get_bd_addr_segs capture2_gpio/S_AXI/Reg]
assign_bd_address -offset 0x412C0000 -range 64K -target_address_space [get_bd_addr_spaces ps7/Data] [get_bd_addr_segs capture3_gpio/S_AXI/Reg]
assign_bd_address -offset 0x43C00000 -range 4K -target_address_space [get_bd_addr_spaces ps7/Data] [get_bd_addr_segs regions_regs/s_axi/reg0]

validate_bd_design
save_bd_design
